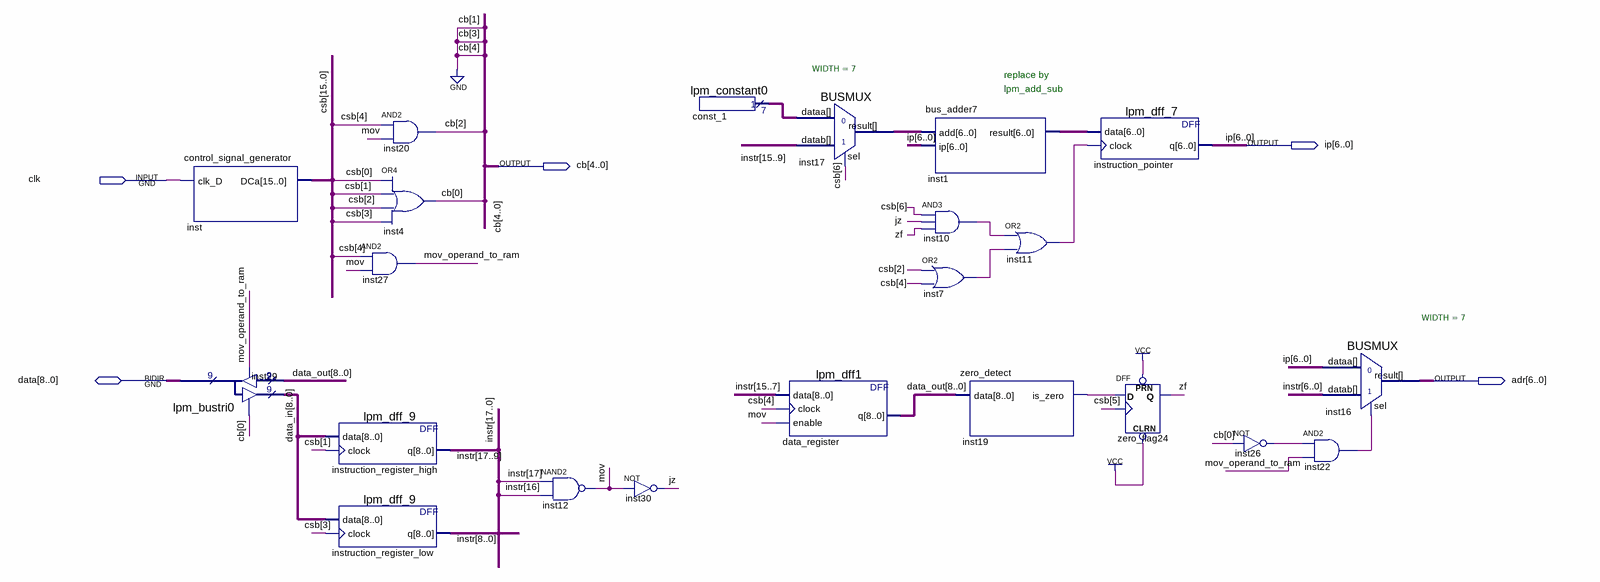
[diagram p0: schematic sheet]
// Quartus schematic control_unit.bdf as structural Verilog: 22 symbols, 5 pins
module control_unit (
  input  clk,
  inout  [8:0] data,
  output [6:0] ip,
  output [4:0] cb,
  output [6:0] adr
);

  wire inst7_out, inst10_out, inst11_out, inst19_is_zero, inst22_out, inst26_out, jz, mov,
       mov_operand_to_ram, zf;
  wire [6:0] const_1_result, inst1_result, inst17_result;
  wire [8:0] data_in, data_out;
  wire [15:0] csb;
  wire [17:0] instr;

  control_signal_generator inst (.clk_D(clk), .DCa(csb));
  lpm_bustri0 inst29 (
    .enabledt(mov_operand_to_ram), .data(data_out), .enabletr(cb[0]), .result(data_in), .tridata(data));
  lpm_dff_9 instruction_register_high (.data(data_in), .clock(csb[1]), .q(instr[17:9]));
  lpm_dff_9 instruction_register_low (.data(data_in), .clock(csb[3]), .q(instr[8:0]));
  and inst20 (cb[2], csb[4], mov);
  or inst4 (cb[0], csb[0], csb[1], csb[2], csb[3]);
  and inst27 (mov_operand_to_ram, csb[4], mov);
  nand inst12 (mov, instr[17], instr[16]);
  not inst30 (jz, mov);
  lpm_constant0 const_1 (.result(const_1_result));
  BUSMUX #(.WIDTH(7)) inst17 (.datab(instr[15:9]), .sel(csb[6]), .dataa(const_1_result), .result(inst17_result));
  lpm_dff1 data_register (.data(instr[15:7]), .clock(csb[4]), .enable(mov), .q(data_out));
  bus_adder7 inst1 (.add(inst17_result), .ip(ip), .result(inst1_result));
  and inst10 (inst10_out, csb[6], jz, zf);
  or inst7 (inst7_out, csb[2], csb[4]);
  zero_detect inst19 (.data(data_out), .is_zero(inst19_is_zero));
  or inst11 (inst11_out, inst10_out, inst7_out);
  lpm_dff_7 instruction_pointer (.data(inst1_result), .clock(inst11_out), .q(ip));
  DFF zero_flag24 (.CLRN(1'b1), .CLK(csb[5]), .D(inst19_is_zero), .PRN(1'b1), .Q(zf));
  not inst26 (inst26_out, cb[0]);
  BUSMUX #(.WIDTH(7)) inst16 (.datab(instr[6:0]), .sel(inst22_out), .dataa(ip), .result(adr));
  and inst22 (inst22_out, inst26_out, mov_operand_to_ram);

  assign {cb[4:3], cb[1]} = 3'b000;

  // Notes on the sheet:
  //   replace by
  //   lpm_add_sub
endmodule
